# EAGLE board RK628H-30P-RevA (EAGLE 9.7.0)
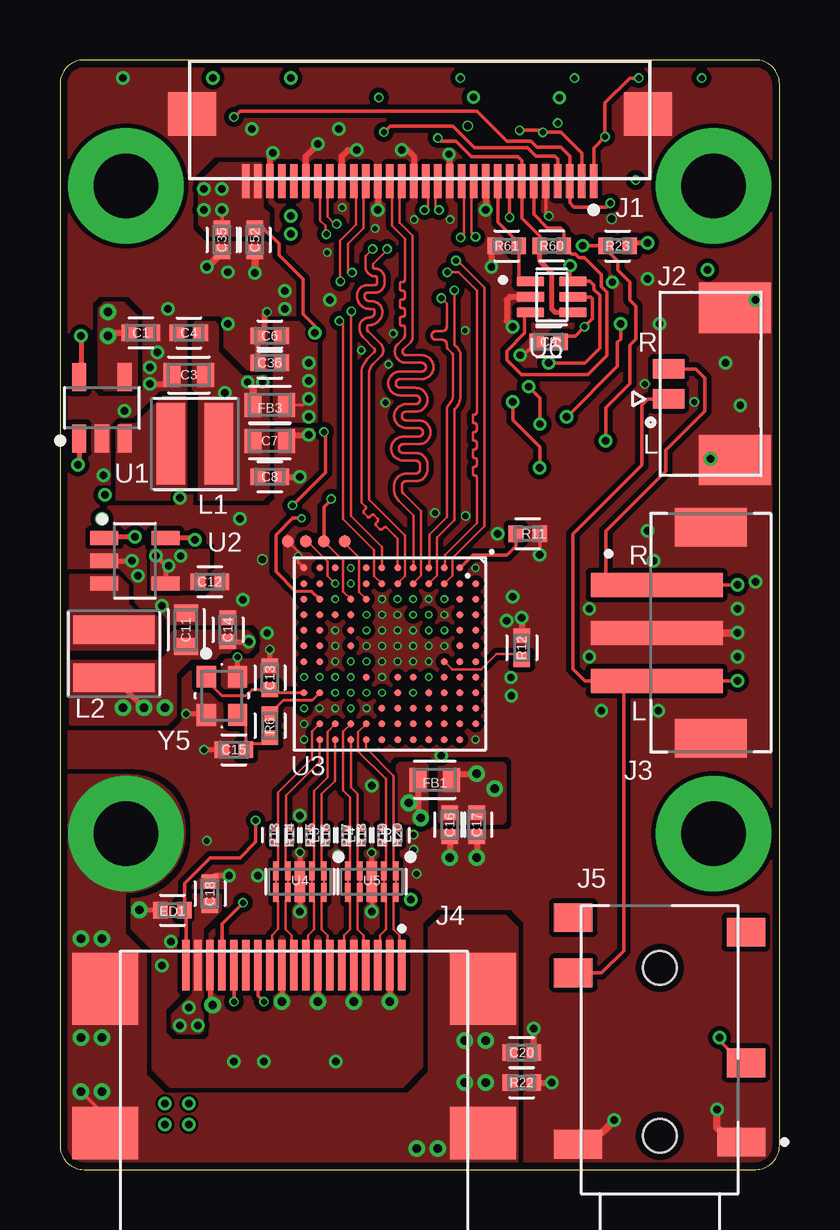
[diagram p8: board, top side]
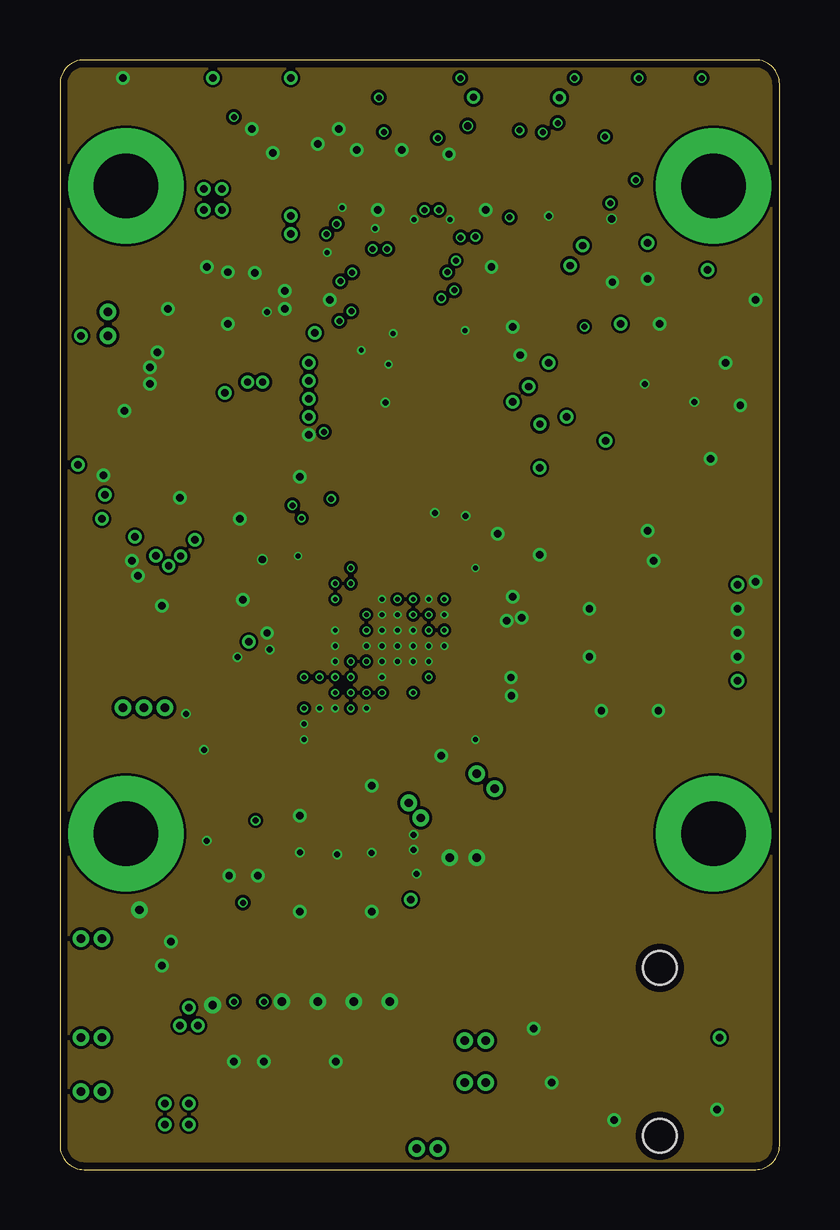
[diagram p9: board, inner layer Route2]
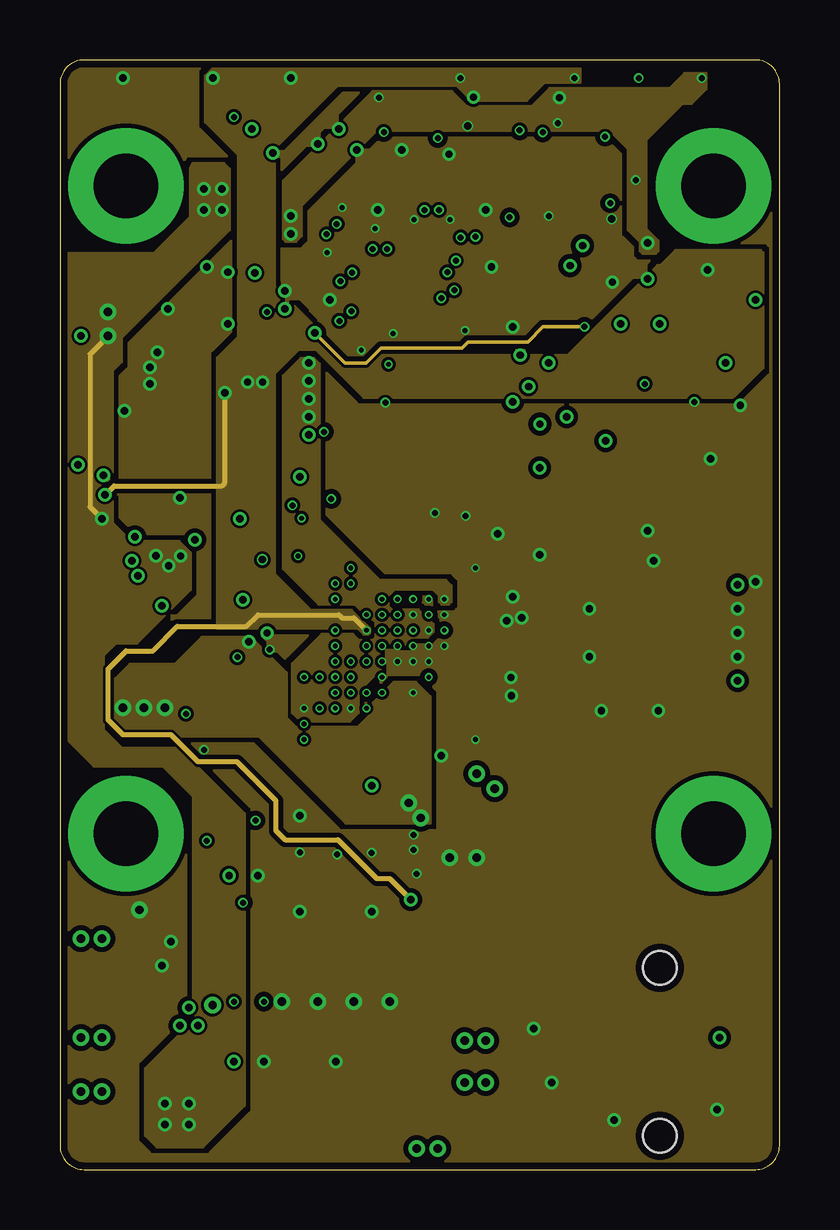
[diagram p10: board, inner layer Route15]
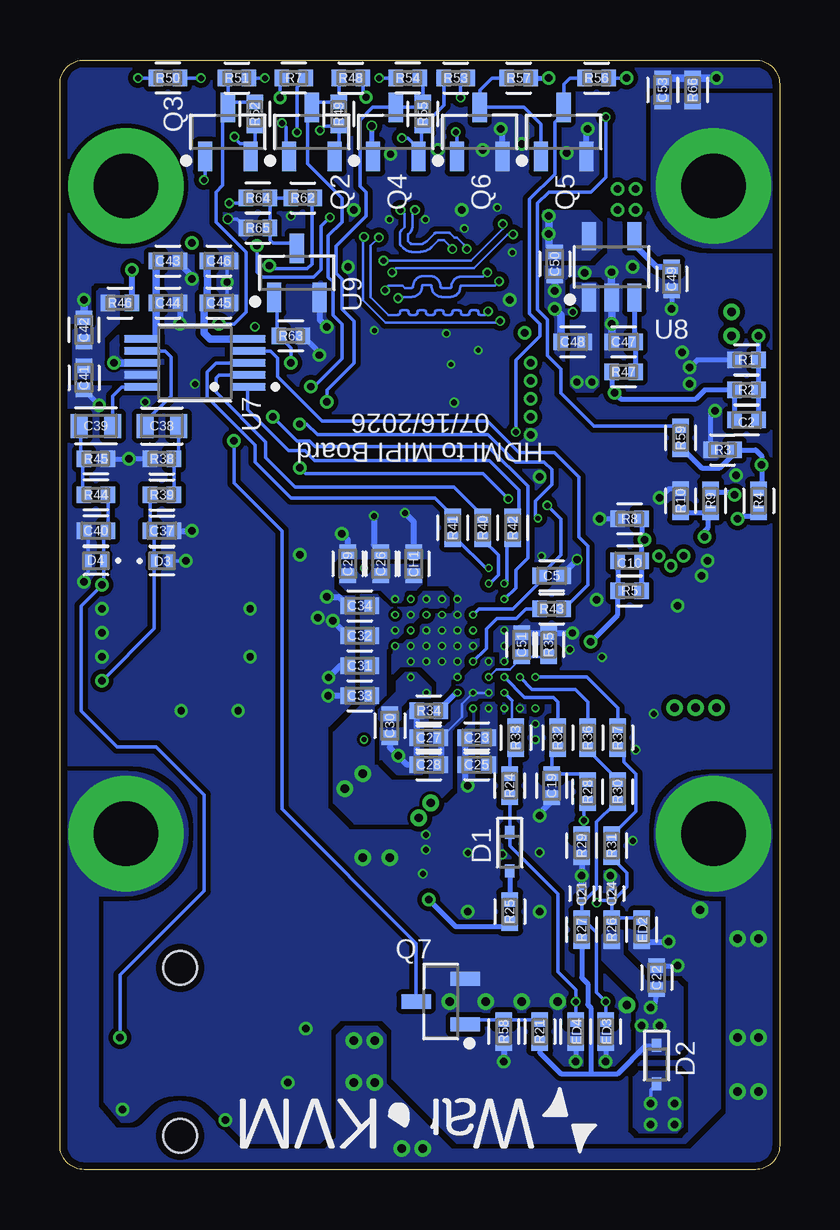
[diagram p11: board, bottom side, seen from below]

Size 30 x 46.25 mm. Coordinates in mm from the lower left corner, seen from the top.
Outline: 1,0 29,0 arc90 30,1 30,45.25 arc90 29,46.25 1,46.25 arc90 0,45.25 0,1 arc90 1,0
Copper layers (1+2*15+16): Top 0.035mm / dielectric 1.5mm / Route2 0.035mm / dielectric 0.15mm / Route15 0.035mm / dielectric 0.2mm / Bottom 0.035mm
Design rules "Fusion Electronics Design Rules *": minimum track width 0.1mm, minimum drill 0.2mm, track to track 0.12mm, track to pad 0.1mm, pad to pad 0.12mm, via to via 0.12mm, smd to smd 0.14mm, copper to edge 0.3mm, drill to drill 6mil, minimum pad ring 0mil, minimum via ring 0mil, stop-mask expansion 0mil, vias tented up to drill 9999mil, thermal gap 10mil
Net classes: 1 ether_diff: width 0.102 mm; 2 usb_diff: width 0.147 mm; 4 hdmi_diff: width 0.113 mm

## Footprints (pad centres in the part's own frame; a part is rotated, then mirrored left to right if it is on the bottom)
CAP_0402 = smd 0.6 x 0.7: 1 -0.5,0; 2 0.5,0
CAP_0603 = smd 0.7 x 1: 1 -0.7,0; 2 0.7,0
CAP_0201 = smd 0.25 x 0.35: 1 -0.275,0; 2 0.275,0
SD103AX = smd 0.54 x 0.404: A 0.796,0; C -0.796,0
DFN100X60X60-2N = smd 0.3 x 0.55: 1 -0.325,0; 2 0.325,0
TVS_0402 = smd 0.6 x 0.7: 1 -0.5,0; 2 0.5,0
IND_0603 = smd 0.7 x 1: 1 -0.7,0; 2 0.7,0
CONN_FFC_1X30_0.5MM_SM_RA_FPC30-T1T1-2021-A = smd 0.3 x 1.4: 1 -7.25,2.55; 2 -6.75,2.55; 3 -6.25,2.55; 4 -5.75,2.55; 5 -5.25,2.55; 6 -4.75,2.55; 7 -4.25,2.55; 8 -3.75,2.55; 9 -3.25,2.55; 10 -2.75,2.55; 11 -2.25,2.55; 12 -1.75,2.55; 13 -1.25,2.55; 14 -0.75,2.55; 15 -0.25,2.55; 16 0.25,2.55; 17 0.75,2.55; 18 1.25,2.55; 19 1.75,2.55; 20 2.25,2.55; 21 2.75,2.55; 22 3.25,2.55; 23 3.75,2.55; 24 4.25,2.55; 25 4.75,2.55; 26 5.25,2.55; 27 5.75,2.55; 28 6.25,2.55; 29 6.75,2.55; 30 7.25,2.55 | smd 2 x 1.8: 31 -9.5,-0.25; 32 9.5,-0.25
CONN_1X02_1.25MM_SM_ST_MX_53398-0271 = smd 0.8 x 1.3: 1 -0.625,2.25; 2 0.625,2.25 | smd 2.1 x 3: S1 3.175,-0.5; S2 -3.175,-0.5
CONN_1X03_2.0MM_SM_ST_JST_B3B-PH-SM4-TB(LF)(SN) = smd 1 x 5.5: 1 -2,-2.25; 2 0,-2.25; 3 2,-2.25 | smd 1.6 x 3: S1 -4.4,0; S2 4.4,0
CONN_HDMI_A_SMT_RA_HC-HDMI0019T-4 = smd 0.3 x 2.1: 1 4.5,6.4; 2 4,6.4; 3 3.5,6.4; 4 3,6.4; 5 2.5,6.4; 6 2,6.4; 7 1.5,6.4; 8 1,6.4; 9 0.5,6.4; 10 0,6.4; 11 -0.5,6.4; 12 -1,6.4; 13 -1.5,6.4; 14 -2,6.4; 15 -2.5,6.4; 16 -3,6.4; 17 -3.5,6.4; 18 -4,6.4; 19 -4.5,6.4 | smd 2.75 x 2.2: 20 -7.875,-0.6; 21 7.875,-0.6 | smd 2.75 x 3: 22 -7.875,5.4; 23 7.875,5.4
CONN_JACK_STEREO_SW_3.5MM_SM_RA_PJ-332-6A = smd 1.2 x 2: 1 2.15,-3.4; 2 2.05,3.4 | smd 1.2 x 1.6: 3 5.45,-3.6; 4 9.2,3.6; 5 10.9,-3.6; 6 11.5,3.6 | hole 1.4: 2.4,0; 9.4,0
IND_3MM_SQ_1.2MM_HEIGHT = smd 1.2 x 3.4: 1 -1,0; 2 1,0
BCMF062P120T = smd 0.25 x 0.35: 1 -0.275,0.3; 2 -0.275,-0.3; 3 0.275,-0.3; 4 0.275,0.3
MOUNTHOLE_M2.5_4.8MM_PAD = drill 2.7 pad 4.8: P$1 0,0
SOT-23-3 = smd 1.229 x 0.592: 1 1.022,-0.95; 2 1.022,0.95; 3 -1.022,0
RES_0402 = smd 0.6 x 0.7: 1 -0.5,0; 2 0.5,0
RES_0201 = smd 0.25 x 0.35: 1 -0.275,0; 2 0.275,0
TEST_POINT_0.5MM = smd 0.5 x 0.5: P$1 0,0
SOT95P285X110-5N = smd 1.172 x 0.592: 1 -1.275,0.95; 2 -1.275,0; 3 -1.275,-0.95; 4 1.275,-0.95; 5 1.275,0.95
WBBGA144_8X8MM = smd 0.3 x 0.3: A1 -3.575,3.575; A2 -2.925,3.575; A3 -2.275,3.575; A4 -1.625,3.575; A5 -0.975,3.575; A6 -0.325,3.575; A7 0.325,3.575; A8 0.975,3.575; A9 1.625,3.575; A10 2.275,3.575; A11 2.925,3.575; A12 3.575,3.575; B1 -3.575,2.925; B2 -2.925,2.925; B3 -2.275,2.925; B4 -1.625,2.925; B5 -0.975,2.925; B6 -0.325,2.925; B7 0.325,2.925; B8 0.975,2.925; B9 1.625,2.925; B10 2.275,2.925; B11 2.925,2.925; B12 3.575,2.925; C1 -3.575,2.275; C2 -2.925,2.275; C3 -2.275,2.275; C4 -1.625,2.275; C5 -0.975,2.275; C6 -0.325,2.275; C7 0.325,2.275; C8 0.975,2.275; C9 1.625,2.275; C10 2.275,2.275; C11 2.925,2.275; C12 3.575,2.275; D1 -3.575,1.625; D2 -2.925,1.625; D3 -2.275,1.625; D4 -1.625,1.625; D5 -0.975,1.625; D6 -0.325,1.625; D7 0.325,1.625; D8 0.975,1.625; D9 1.625,1.625; D10 2.275,1.625; D11 2.925,1.625; D12 3.575,1.625; E1 -3.575,0.975; E2 -2.925,0.975; E3 -2.275,0.975; E4 -1.625,0.975; E5 -0.975,0.975; E6 -0.325,0.975; E7 0.325,0.975; E8 0.975,0.975; E9 1.625,0.975; E10 2.275,0.975; E11 2.925,0.975; E12 3.575,0.975; F1 -3.575,0.325; F2 -2.925,0.325; F3 -2.275,0.325; F4 -1.625,0.325; F5 -0.975,0.325; F6 -0.325,0.325; F7 0.325,0.325; F8 0.975,0.325; F9 1.625,0.325; F10 2.275,0.325; F11 2.925,0.325; F12 3.575,0.325; G1 -3.575,-0.325; G2 -2.925,-0.325; G3 -2.275,-0.325; G4 -1.625,-0.325; G5 -0.975,-0.325; G6 -0.325,-0.325; G7 0.325,-0.325; G8 0.975,-0.325; G9 1.625,-0.325; G10 2.275,-0.325; G11 2.925,-0.325; G12 3.575,-0.325; H1 -3.575,-0.975; H2 -2.925,-0.975; H3 -2.275,-0.975; H4 -1.625,-0.975; H5 -0.975,-0.975; H6 -0.325,-0.975; H7 0.325,-0.975; H8 0.975,-0.975; H9 1.625,-0.975; H10 2.275,-0.975; H11 2.925,-0.975; H12 3.575,-0.975; J1 -3.575,-1.625; J2 -2.925,-1.625; J3 -2.275,-1.625; J4 -1.625,-1.625; J5 -0.975,-1.625; J6 -0.325,-1.625; J7 0.325,-1.625; J8 0.975,-1.625; J9 1.625,-1.625; J10 2.275,-1.625; J11 2.925,-1.625; J12 3.575,-1.625; K1 -3.575,-2.275; K2 -2.925,-2.275; K3 -2.275,-2.275; K4 -1.625,-2.275; K5 -0.975,-2.275; K6 -0.325,-2.275; K7 0.325,-2.275; K8 0.975,-2.275; K9 1.625,-2.275; K10 2.275,-2.275; K11 2.925,-2.275; K12 3.575,-2.275; L1 -3.575,-2.925; L2 -2.925,-2.925; L3 -2.275,-2.925; L4 -1.625,-2.925; L5 -0.975,-2.925; L6 -0.325,-2.925; L7 0.325,-2.925; L8 0.975,-2.925; L9 1.625,-2.925; L10 2.275,-2.925; L11 2.925,-2.925; L12 3.575,-2.925; M1 -3.575,-3.575; M2 -2.925,-3.575; M3 -2.275,-3.575; M4 -1.625,-3.575; M5 -0.975,-3.575; M6 -0.325,-3.575; M7 0.325,-3.575; M8 0.975,-3.575; M9 1.625,-3.575; M10 2.275,-3.575; M11 2.925,-3.575; M12 3.575,-3.575
DFN2510-10 = smd 0.224 x 0.793: 1 -1,-0.455; 2 -0.5,-0.455; 4 0.5,-0.455; 5 1,-0.455; 6 1,0.455; 7 0.5,0.455; 9 -0.5,0.455; 10 -1,0.455 | smd 0.424 x 0.793: 3 0,-0.455; 8 0,0.455
SOT65P210X110-6N = smd 1.15 x 0.4: 1 0.89,-0.65; 2 0.89,0; 3 0.89,0.65; 4 -0.89,0.65; 5 -0.89,0; 6 -0.89,-0.65
SOP50P490X110-10N = smd 0.32 x 1.5: 1 -1,-2.2; 2 -0.5,-2.2; 3 0,-2.2; 4 0.5,-2.2; 5 1,-2.2; 6 1,2.2; 7 0.5,2.2; 8 0,2.2; 9 -0.5,2.2; 10 -1,2.2
SOT95P285X110-5N_ROTATED90 = smd 0.592 x 1.172: 1 -0.95,-1.275; 2 0,-1.275; 3 0.95,-1.275; 4 0.95,1.275; 5 -0.95,1.275
CRYSTAL_SMD2016-4P = smd 0.9 x 0.8: 1 -0.8,-0.65; 2 0.8,-0.65; 3 0.8,0.65; 4 -0.8,0.65

## Placement (x,y rotation side)
C1  10uF 10V  [CAP_0402]  3.38,34.88 180 top
C2  100pF 50V  [CAP_0402]  1.38,31.25 180 bottom
C3  22uF 10V  [CAP_0603]  5.38,33.12 0 top
C4  0.1uF 16V  [CAP_0402]  5.38,34.88 0 top
C5  0.1uF 16V  [CAP_0402]  9.5,24.75 180 bottom
C6  10uF 10V  [CAP_0402]  8.75,34.75 0 top
C7  22uF 10V  [CAP_0603]  8.75,30.38 180 top
C8  0.1uF 16V  [CAP_0402]  8.75,28.88 180 top
C9  0.1uF 16V  [CAP_0402]  20.38,34.5 180 top
C10  100pF 50V  [CAP_0402]  6.25,25.38 180 bottom
C11  22uF 10V  [CAP_0603]  5.25,22.5 270 top
C12  10uF 10V  [CAP_0402]  6.25,24.5 180 top
C13  33pF 50V  [CAP_0402]  8.75,20.5 270 top
C14  0.1uF 16V  [CAP_0402]  7,22.5 270 top
C15  33pF 50V  [CAP_0402]  7.25,17.5 0 top
C16  0.1uF 16V  [CAP_0402]  16.25,14.38 90 top
C17  10uF 10V  [CAP_0402]  17.38,14.38 90 top
C18  0.1uF 16V  [CAP_0402]  6.25,11.5 270 top
C19  0.1uF 16V  [CAP_0402]  9.5,16 90 bottom
C20  0.1uF 16V  [CAP_0402]  19.25,4.88 180 top
C21  NC/10pF 50V  [CAP_0201]  8.25,11.5 270 bottom
C22  1uF 25V  [CAP_0402]  5.12,8 270 bottom
C23  10uF 10V  [CAP_0402]  12.62,18 0 bottom
C24  NC/10pF 50V  [CAP_0201]  7,11.5 270 bottom
C25  0.1uF 16V  [CAP_0402]  12.62,16.88 0 bottom
C26  10uF 10V  [CAP_0402]  16.62,25.25 270 bottom
C27  0.1uF 16V  [CAP_0402]  14.62,18 0 bottom
C28  10uF 10V  [CAP_0402]  14.62,16.88 0 bottom
C29  0.1uF 16V  [CAP_0402]  18,25.25 270 bottom
C30  0.1uF 16V  [CAP_0402]  16.25,18.5 270 bottom
C31  0.1uF 16V  [CAP_0402]  17.5,21 0 bottom
C32  0.1uF 16V  [CAP_0402]  17.5,22.25 0 bottom
C33  10uF 10V  [CAP_0402]  17.5,19.75 0 bottom
C34  0.1uF 16V  [CAP_0402]  17.5,23.5 0 bottom
C35  0.1uF 16V  [CAP_0402]  6.75,38.75 270 top
C36  0.1uF 16V  [CAP_0402]  8.75,33.62 0 top
C37  4.3nF 10V  [CAP_0402]  25.75,26.62 0 bottom
C38  3.3uF 10V  [CAP_0603]  25.75,31 0 bottom
C39  3.3uF 10V  [CAP_0603]  28.5,31 180 bottom
C40  4.3nF 10V  [CAP_0402]  28.5,26.62 180 bottom
C41  0.1uF 16V  [CAP_0402]  29,33 270 bottom
C42  10uF 10V  [CAP_0402]  29,35 90 bottom
C43  10uF 10V  [CAP_0402]  25.5,37.88 0 bottom
C44  0.1uF 16V  [CAP_0402]  25.5,36.12 0 bottom
C45  10uF 10V  [CAP_0402]  23.38,36.12 0 bottom
C46  0.1uF 16V  [CAP_0402]  23.38,37.88 0 bottom
C47  0.1uF 16V  [CAP_0402]  6.5,34.5 180 bottom
C48  4.7uF 10V  [CAP_0402]  8.62,34.5 180 bottom
C49  0.1uF 16V  [CAP_0402]  4.5,37.12 270 bottom
C50  4.7uF 10V  [CAP_0402]  9.38,37.75 270 bottom
C51  0.1uF 16V  [CAP_0402]  10.75,21.88 90 bottom
C52  10uF 10V  [CAP_0402]  8.12,38.75 270 top
C53  0.1uF 16V  [CAP_0402]  4.88,45 270 bottom
CH1  0.1uF 16V  [CAP_0402]  15.25,25.25 270 bottom
D1  SD103AX  [SD103AX]  11.25,13.25 270 bottom
D2  SD103AX  [SD103AX]  5.12,4.38 270 bottom
D3  ESD5451N  [DFN100X60X60-2N]  25.75,25.38 0 bottom
D4  ESD5451N  [DFN100X60X60-2N]  28.5,25.38 180 bottom
ED1  KLXES15AAA1  [TVS_0402]  4.69,10.81 0 top
ED2  KLXES15AAA1  [TVS_0402]  5.75,10 90 bottom
ED3  KLXES15AAA1  [TVS_0402]  7.25,5.75 90 bottom
ED4  KLXES15AAA1  [TVS_0402]  8.5,5.75 90 bottom
FB1  120Ω 2A  [IND_0603]  15.62,16.25 0 top
FB3  120Ω 2A  [IND_0603]  8.75,31.88 0 top
J1  FPC30-T1T1-2021-A  [CONN_FFC_1X30_0.5MM_SM_RA_FPC30-T1T1-2021-A]  15,43.75 180 top
J2  53398-0271  [CONN_1X02_1.25MM_SM_ST_MX_53398-0271]  27.62,32.75 90 top
J3  B3B-PH-SM4-TB  [CONN_1X03_2.0MM_SM_ST_JST_B3B-PH-SM4-TB(LF)(SN)]  27.12,22.38 270 top
J4  HC-HDMI0019T-4  [CONN_HDMI_A_SMT_RA_HC-HDMI0019T-4]  9.75,2.12 0 top
J5  PJ-332-6A  [CONN_JACK_STEREO_SW_3.5MM_SM_RA_PJ-332-6A]  25,-1 90 top
L1  2.2uH 2.84A  [IND_3MM_SQ_1.2MM_HEIGHT]  5.62,30.25 0 top
L2  2.2uH 2.84A  [IND_3MM_SQ_1.2MM_HEIGHT]  2.25,21.5 270 top
L3  NC/BCMF062P120T  [BCMF062P120T]  9.25,13.94 270 top
L4  NC/BCMF062P120T  [BCMF062P120T]  10.75,13.94 270 top
L5  NC/BCMF062P120T  [BCMF062P120T]  12.25,13.94 270 top
L6  NC/BCMF062P120T  [BCMF062P120T]  13.75,13.94 270 top
MNT1  MOUNTHOLE_M2.5_4.8MM_PAD  [MOUNTHOLE_M2.5_4.8MM_PAD]  2.75,41 0 top
MNT2  MOUNTHOLE_M2.5_4.8MM_PAD  [MOUNTHOLE_M2.5_4.8MM_PAD]  27.25,41 0 top
MNT3  MOUNTHOLE_M2.5_4.8MM_PAD  [MOUNTHOLE_M2.5_4.8MM_PAD]  2.75,14 0 top
MNT4  MOUNTHOLE_M2.5_4.8MM_PAD  [MOUNTHOLE_M2.5_4.8MM_PAD]  27.25,14 0 top
Q2  2SK3018  [SOT-23-3]  19.5,43.25 270 bottom
Q3  2SK3018  [SOT-23-3]  23,43.25 270 bottom
Q4  2SK3018  [SOT-23-3]  16,43.25 270 bottom
Q5  2SK3018  [SOT-23-3]  9,43.25 270 bottom
Q6  2SK3018  [SOT-23-3]  12.5,43.25 270 bottom
Q7  S8050  [SOT-23-3]  14.12,7 0 bottom
R1  51kΩ 1%  [RES_0402]  1.38,33.75 180 bottom
R2  232kΩ 1%  [RES_0402]  1.38,32.5 0 bottom
R3  47kΩ 1%  [RES_0402]  2.38,30 0 bottom
R4  47kΩ 1%  [RES_0402]  0.88,27.88 270 bottom
R5  110kΩ 1%  [RES_0402]  6.25,24.12 0 bottom
R6  22Ω 1%  [RES_0402]  8.75,18.5 270 top
R7  NC/2.2kΩ 1%  [RES_0402]  20.25,45.5 180 bottom
R8  120kΩ 1%  [RES_0402]  6.25,27.12 180 bottom
R9  10kΩ 1%  [RES_0402]  2.88,27.88 90 bottom
R10  100kΩ 1%  [RES_0402]  4.12,27.88 90 bottom
R11  4.02kΩ 1%  [RES_0402]  19.5,26.5 180 top
R12  10kΩ 1%  [RES_0402]  19.25,21.75 270 top
R13  2.2Ω 5%  [RES_0201]  8.94,13.94 90 top
R14  2.2Ω 5%  [RES_0201]  9.56,13.94 90 top
R15  2.2Ω 5%  [RES_0201]  10.44,13.94 90 top
R16  2.2Ω 5%  [RES_0201]  11.06,13.94 90 top
R17  2.2Ω 5%  [RES_0201]  11.94,13.94 90 top
R18  2.2Ω 5%  [RES_0201]  12.56,13.94 90 top
R19  2.2Ω 5%  [RES_0201]  13.44,13.94 90 top
R20  2.2Ω 5%  [RES_0201]  14.06,13.94 90 top
R21  10kΩ 1%  [RES_0402]  10,5.75 270 bottom
R22  1MΩ 1%  [RES_0402]  19.25,3.62 0 top
R23  4.7kΩ 1%  [RES_0402]  23.25,38.5 0 top
R24  100Ω 1%  [RES_0402]  11.25,16 90 bottom
R25  27kΩ 1%  [RES_0402]  11.25,10.75 270 bottom
R26  1.8kΩ 1%  [RES_0402]  7,10 90 bottom
R27  1.8kΩ 1%  [RES_0402]  8.25,10 90 bottom
R28  1kΩ 1%  [RES_0402]  8,15.75 90 bottom
R29  100kΩ 1%  [RES_0402]  8.25,13.5 90 bottom
R30  100Ω 1%  [RES_0402]  6.75,15.75 90 bottom
R31  100Ω 1%  [RES_0402]  7,13.5 90 bottom
R32  22Ω 1%  [RES_0402]  9.25,18 270 bottom
R33  22Ω 1%  [RES_0402]  11,18 270 bottom
R34  2kΩ 1%  [RES_0402]  14.62,19.12 0 bottom
R35  100Ω 1%  [RES_0402]  9.62,21.88 90 bottom
R36  22Ω 1%  [RES_0402]  8,18 270 bottom
R37  22Ω 1%  [RES_0402]  6.75,18 270 bottom
R38  10kΩ 1%  [RES_0402]  25.75,29.62 0 bottom
R39  470Ω 1%  [RES_0402]  25.75,28.12 0 bottom
R40  33Ω 1%  [RES_0402]  12.38,26.75 90 bottom
R41  33Ω 1%  [RES_0402]  13.62,26.75 90 bottom
R42  33Ω 1%  [RES_0402]  11.12,26.75 90 bottom
R43  33Ω 1%  [RES_0402]  9.5,23.38 0 bottom
R44  470Ω 1%  [RES_0402]  28.5,28.12 180 bottom
R45  10kΩ 1%  [RES_0402]  28.5,29.62 180 bottom
R46  10Ω 1%  [RES_0402]  27.5,36.12 0 bottom
R47  10kΩ 1%  [RES_0402]  6.5,33.25 180 bottom
R48  2.2kΩ 1%  [RES_0402]  17.88,45.5 0 bottom
R49  NC/0Ω 1%  [RES_0402]  18.38,44 90 bottom
R50  NC/2.2kΩ 1%  [RES_0402]  25.5,45.5 180 bottom
R51  2.2kΩ 1%  [RES_0402]  22.62,45.5 0 bottom
R52  NC/0Ω 1%  [RES_0402]  21.88,44 90 bottom
R53  NC/2.2kΩ 1%  [RES_0402]  13.5,45.5 0 bottom
R54  2.2kΩ 1%  [RES_0402]  15.5,45.5 180 bottom
R55  NC/0Ω 1%  [RES_0402]  14.88,44 90 bottom
R56  10kΩ 1%  [RES_0402]  7.62,45.5 0 bottom
R57  10kΩ 1%  [RES_0402]  10.88,45.5 0 bottom
R58  51kΩ 1%  [RES_0402]  11.5,5.75 90 bottom
R59  NC/1kΩ 1%  [RES_0402]  4.12,30.5 90 bottom
R60  NC/0Ω 1%  [RES_0402]  20.5,38.5 180 top
R61  NC/1MΩ 1%  [RES_0402]  18.62,38.5 0 top
R62  0Ω 1%  [RES_0402]  19.88,40.5 0 bottom
R63  NC/100kΩ 1%  [RES_0402]  20.38,34.75 180 bottom
R64  10kΩ 1%  [RES_0402]  21.75,40.5 180 bottom
R65  30kΩ 1%  [RES_0402]  21.75,39.25 0 bottom
R66  1MΩ 1%  [RES_0402]  3.62,45 90 bottom
TP1  TEST_POINT_1MM  [TEST_POINT_0.5MM]  9.5,26.19 0 top
TP2  TEST_POINT_1MM  [TEST_POINT_0.5MM]  10.25,26.19 0 top
TP3  TEST_POINT_1MM  [TEST_POINT_0.5MM]  11.88,26.19 0 top
TP4  TEST_POINT_1MM_0.5MM  [TEST_POINT_0.5MM]  11,26.19 0 top
U1  SY8089A1AAC  [SOT95P285X110-5N]  1.75,31.75 90 top
U2  SY8089A1AAC  [SOT95P285X110-5N]  3.12,25.38 0 top
U3  RK628H  [WBBGA144_8X8MM]  13.75,21.5 270 top
U4  BTRD10A03  [DFN2510-10]  10,12 180 top
U5  BTRD10A03  [DFN2510-10]  13,12 180 top
U6  SGM3157YC6  [SOT65P210X110-6N]  20.5,36.38 180 top
U7  GC4344  [SOP50P490X110-10N]  24.38,33.62 90 bottom
U8  RT9193-33GB  [SOT95P285X110-5N_ROTATED90]  7,37.62 0 bottom
U9  NC/ME2808A33XG  [SOT-23-3]  20.12,37.38 270 bottom
Y5  24MHz 20pF  [CRYSTAL_SMD2016-4P]  6.75,19.75 270 top

## Tracks (layer width: path | path; a pad name or v marks a point on that pad's centre or on a via)
CGND  (via drill 0.35 pad 0.7)
  Top 0.152: J4.20 1.88,2.25 v0.88,3.25
  other vias: 1.75,3.25 0.88,5.5 1.75,5.5 0.88,9.62 1.75,9.62 15.75,0.88 14.88,0.88 16.88,5.38 17.75,5.38 16.88,3.62 17.75,3.62
  pour Top (no thermals): 3.57,3.98 3.57,8.98 2.7,9.85 2.7,11.5 2.7,11.52 2.7,11.52 2.7,11.52 2.71,11.53 2.73,11.55 2.73,11.55 2.73,11.55 2.75,11.55 3.1,11.58 3.44,11.65 3.77,11.77 4.07,11.94 4.35,12.15 4.6,12.4 4.81,12.68 4.98,12.98 5.1,13.31 5.17,13.65 5.2,14 5.2,14.16 5.17,14.52 5.09,14.87 4.95,15.2 4.76,15.5 4.53,15.78 4.25,16.01 3.95,16.2 3.62,16.34 3.27,16.42 2.91,16.45 -0.82,16.45 -0.82,0.27 -0.35,-0.2 19.07,-0.2 19.07,10.1 18.6,10.57 15.9,10.57 15.39,10.07 15.39,4.07 14.49,3.16 4.39,3.16
  pour Bottom (no thermals): 3.73,0.8 3.71,0.81 2.19,2.33 2.17,2.36 2.17,11.39 2.19,11.42 2.21,11.44 2.23,11.45 2.75,11.45 3.09,11.48 3.43,11.55 3.76,11.67 4.06,11.84 4.34,12.04 4.58,12.29 4.79,12.56 4.95,12.87 5.08,13.19 5.15,13.53 5.17,13.88 5.17,14.15 5.15,14.51 5.06,14.86 4.93,15.19 4.74,15.49 4.51,15.76 4.24,15.99 3.94,16.18 3.61,16.31 3.26,16.4 2.9,16.42 0.08,16.42 0.08,0.03 0.16,-0.05 30.3,-0.05 30.3,16.55 27.17,16.55 26.82,16.52 26.48,16.45 26.14,16.33 25.84,16.16 25.55,15.95 25.3,15.7 25.09,15.41 24.92,15.11 24.8,14.77 24.73,14.43 24.7,14.08 24.73,13.71 24.81,13.34 24.94,12.99 25.12,12.66 25.34,12.36 25.61,12.09 25.91,11.87 26.24,11.69 26.59,11.56 26.96,11.48 27.33,11.45 28.39,11.45 28.42,11.44 28.44,11.42 28.45,11.39 28.45,2.63 28.45,2.62 28.45,2.61 28.45,2.61 28.45,2.6 28.44,2.59 28.44,2.58 28.44,2.58 28.43,2.57 27.69,1.71 27.69,1.71 27.68,1.7 27.67,1.69 27.67,1.69 27.67,1.69 27.66,1.68 27.65,1.68 27.64,1.67 27.64,1.67 27.63,1.67 27.62,1.67 27.61,1.67 27.01,1.67 27.01,1.67 27,1.67 26.98,1.67 26.98,1.68 26.88,1.69 26.87,1.68 26.87,1.69 26.86,1.69 26.85,1.69 26.75,1.72 26.75,1.72 26.74,1.73 26.73,1.73 26.73,1.73 26.64,1.78 26.63,1.78 26.62,1.79 26.62,1.79 26.61,1.8 26.53,1.86 26.53,1.86 26.52,1.87 26.51,1.88 26.51,1.88 25.98,2.41 25.82,2.55 25.65,2.66 25.46,2.73 25.25,2.78 25.05,2.8 24.95,2.8 24.75,2.78 24.54,2.73 24.35,2.66 24.18,2.55 24.02,2.41 22.42,0.81 22.39,0.8 18.98,0.8 18.96,0.81 18.44,1.33 18.42,1.36 18.42,5.59 18.09,5.92 16.78,5.92 16.45,5.59 16.45,3.61 16.44,3.58 13.67,0.81 13.64,0.8
GND  (via drill 0.2 pad 0.33, 0.2 pad 0.35, 0.25 pad 0.4, 0.3 pad 0.4, 0.3 pad 0.55, 0.35 pad 0.7)
  Top 0.113: v9.93,25.57 9.93,25.76 TP1.P$1
  Top 0.152: J1.5 20.25,39.88 v20.38,39.75 | R11.1 v20,25.62 | C7.1 9.5,30.43 9.5,30.62 | C9.2 19.32,33.95 v19.19,33.95 | U3.M1 9.93,25.32 v9.93,25.57
  Top 0.203: J4.5 v12.25,7 | J4.2 v13.75,7 | J4.8 v10.75,7 | J4.11 v9.25,7 | v13,10.75 U5.8 U5.3 v12.99,13.21 | v10,10.75 U4.8 U4.3 v10,13.22 | C15.1 v6,17.5 | Y5.2 6.05,19 v5.25,19 | Y5.4 v7.4,21.35 v7.4,21.36 | v8.74,21.67 C13.1 | ED1.1 v3.32,10.81 v3.31,10.82 | v6.36,6.85 6.25,6.97 J4.17 | U2.2 v3,25.38 | C36.1 C6.1 8.5,35 8.5,35.62 v8.62,35.75
  Top 0.254: 6.17,12.08 C18.1 6.5,12.25 v7.05,12.25 | v3.75,32.75 4.3,32.75 C3.1 | J1.28 8.75,42.25 v8.88,42.38 | J1.25 10.25,42.25 v10.75,42.75 | J1.22 11.75,42.25 12,42.5 v12.38,42.5 | J1.19 v13.25,40 | v14.25,42.5 14.5,42.5 14.75,42.25 J1.16 | v16.22,42.33 16.24,42.3 J1.13 | J1.10 v17.75,40 | C16.1 v16.25,13 | C17.1 v17.38,13 | R61.1 17.98,38.36 v17.98,37.63 | U6.2 18.75,36.38 18.62,36.25 18.62,35.38 v18.88,35.12 | v19.25,23 R12.1 | 9.5,30.62 v10.38,30.62 | C8.1 v10,28.88 | C20.1 v19.75,5.88 | R22.2 v20.5,3.62
  Top 0.305: J3.2 v28.25,22.38 | v23.11,2.06 22.1,1.05 J5.2 | J5.1 28,1.15 27.39,1.75 v27.39,2.5 | C35.2 v6.12,37.62 | C52.2 v8.12,37.38
  Bottom 0.152: C37.2 25.43,26.45 | C40.2 28.82,26.45 D4.2 28.82,24.93 29,24.75 v29,24.5 | D3.2 v24.75,25.38 | C45.2 23.03,36.28 v23.03,36.99 23.03,37.72 C46.2 | R65.1 22.62,39.62 v23,39.62
  Bottom 0.203: ED4.1 v8.5,4.5 | ED3.1 v7.25,4.5 | C22.1 v4.25,8.5 | R1.2 3.44,33.75 v3.75,33.44 | R3.1 2.88,31.62 v2.69,31.62 | R10.2 4.62,28.38 v5,28 | R8.2 v7.5,27.12 | C49.2 v4.5,35.88 | R63.1 19.19,34.06 v19.19,33.95 | C41.2 28.37,31.87 v28.37,31.85 | R38.1 v27.12,29.62 R45.1 | C43.2 25,37.75 | C23.1 C25.1 13.12,16.12
  Bottom 0.254: R29.1 v8.25,12.25 C21.1 | v7.05,12.25 7.05,11.83 C24.1 | C19.1 9.5,15.38 10,14.88 v10,14.75 | ED2.1 v4.62,9.5 | C51.2 R35.2 9.61,22.36 v8.63,22.36 | Q5.2 8.05,43.33 v8,43.38 | Q6.2 11.55,43.3 v11.62,43.38 | C23.1 13.12,16.12 v13,16 | C37.2 v24.5,26.62 | U9.2 19.18,35.42 v18.88,35.12 | v18.82,19.75 C33.1 | v18.88,23.88 18.38,23.88 C34.1 | C32.1 v18.62,22.88 | C31.1 18.32,21 v18.8,20.51 | Q7.2 13.05,7.95 13,8 | C30.2 16.25,17.6 v15.9,17.25 15.52,16.88 C28.1 C27.1 R34.1 | R58.1 v11.5,4.5 | 25,37.75 24.5,37.25 v24.5,37.12 | C44.2 v25,35.25 | C29.1 18,26.25 v18.25,26.5 | v16.91,27.25 16.91,26.04 C26.1 | CH1.1 15.25,27 v15.62,27.38 | C5.1 9,24.86 v8.44,25.42
  Bottom 0.305: U7.8 v27.75,33.62 | C42.2 v29,36.25 | C50.2 v9.38,36.62 | C48.2 9.12,35.62 v9.38,35.88 | v7,37.41 U8.2 v7,35.25 C47.2 | C53.1 R66.2 v2.62,45.5
  other vias: 10.82,19.23 10.18,18.57 10.18,17.93 11.47,19.23 17.32,17.93 12.78,19.23 11.47,21.18 11.47,21.82 11.47,22.48 12.78,21.82 13.43,21.18 13.43,20.52 14.07,21.18 14.72,21.18 15.38,21.18 13.43,21.82 13.43,22.48 13.43,23.12 14.07,23.12 14.07,22.48 14.72,22.48 14.07,21.82 14.72,21.82 15.38,21.82 16.02,21.82 16.02,23.12 15.38,23.77 13.43,23.77 4.06,34.06 1.81,28.94 3.25,24.75 4.25,23.5 7.62,23.75 17.32,25.07 11.25,36.25 13.57,31.97 13.89,34.85 13.7,33.56 12.56,34.15 11.14,38.22 11.76,40.1 16.26,39.6 13.14,39.22 14.76,39.6 16.89,34.97 24.38,32.75 26.45,31.99 22.57,19.13 24.95,19.13 22.07,23.38 22.07,21.38 28.25,23.38 28.25,21.38 11.56,13.13 14.74,13.96 14.74,13.33 14.87,12.33 6.12,13.71
  pour Route2 (no thermals): -0.69,-0.19 30.19,-0.19 30.19,46.44 -0.69,46.44
  pour Top (no thermals): 3.56,35.44 3.56,32.6 3.15,32.19 1.59,32.19 1.37,31.98 1.37,28.56 2.07,28.56 2.07,31.02 2.41,31.37 3.04,31.37 4.16,32.49 5.16,32.49 5.26,32.59 5.26,35.35 5.16,35.44
  pour Top (no thermals): 3.17,23.66 3.35,23.47 3.99,23.47 4.02,23.46 4.66,22.83 7.92,22.83 7.92,24.92 6.41,24.92 6.33,24.84 6.33,24.11 6.31,24.08 6.04,23.81 6.02,23.8 3.73,23.8 3.71,23.81 3.56,23.96 3.55,23.98 3.55,25.8 0.45,25.8 0.45,25.12 2.43,25.12 2.46,25.11 3.16,24.41 3.17,24.38
  pour Route15 (no thermals): 11.52,34.68 15.73,34.68 18.2,37.15 18.2,39.98 17.48,40.7 11.9,40.7 10.43,39.23 10.43,35.77
  pour Top (isolate 0.203, rank 6, no thermals): -0.69,-0.19 30.19,-0.19 30.19,46.44 -0.69,46.44
  pour Bottom (isolate 0.203, rank 6, no thermals): -0.6,-0.15 30.28,-0.15 30.28,46.49 -0.6,46.49
  pour Route15 (isolate 0.203, rank 6, no thermals): -0.69,-0.19 30.19,-0.19 30.19,46.44 -0.69,46.44
HDMI_1-CEC  (via drill 0.25 pad 0.4)
  Top 0.152: J4.13 8.25,7.25 v8.5,7
  Bottom 0.152: ED4.2 v8.5,7 8.5,7.5 9.25,8.25 9.25,11.5 11.25,13.5 D1.C R24.1
HDMI_1-HPD  (via drill 0.25 pad 0.4)
  Top 0.152: J4.19 5.25,10.75 ED1.2 5.19,11.94 6.25,13 7.5,13 8.16,13.66 v8.16,14.55
  Bottom 0.152: R28.1 8.16,15.09 v8.16,14.55 8.16,14.09 R29.2
HDMI_1-SCL  (via drill 0.25 pad 0.4)
  Top 0.152: J4.15 v7.25,7
  Bottom 0.152: R30.1 6.88,15.25 7.64,14.48 7.64,11.7 8.12,11.22 C21.2 R27.2 7.63,9.88 7.63,7.38 v7.25,7 ED3.2
HDMI_1-SDA  (via drill 0.25 pad 0.4)
  Top 0.152: J4.16 6.75,10.25 7.5,11 7.62,11 v7.62,11.12
  Bottom 0.152: R31.1 6.38,12.38 6.38,11.78 6.93,11.22 C24.2 | C24.2 R26.2 ED2.2 | C24.2 7.53,11.22 v7.62,11.12
HDMIIN_INTN  (via drill 0.25 pad 0.4)
  Top 0.152: v15.75,43 15.88,42.88 16.5,42.88 17.17,42.21 19.08,42.21 19.25,42.04 J1.7 19.25,39.65 20,38.9 R60.2
  Top 0.203: U6.4 20.65,35.73 20.5,35.88 20.5,37.38 20,37.88 R60.2
  Bottom 0.152: v15.75,43 15.5,43 15.05,42.55 Q4.2 15.05,42.38 14.93,42.38 14.93,43.45 R55.1 14,44.38 R53.1
HDMIIN_PWR_EN/DET  (via drill 0.25 pad 0.4)
  Top 0.152: v7.25,43.88 7.5,44.12 17.38,44.12 18.62,42.88 19.62,42.88 19.88,42.62 20.88,42.62 21.25,42.25 J1.3 21.25,40.29 21.42,40.12 22.78,40.12 v22.94,40.28
  Bottom 0.152: R59.2 7.75,31 9.12,32.38 9.12,33.38 9.69,33.94 9.69,35.44 10.09,35.84 10.09,40.28 9.62,40.75 7.88,40.75 7.25,41.38 v7.25,43.88 | v22.94,40.28 22.47,40.28 R64.2
HDMIIN_RSTN  (via drill 0.25 pad 0.4)
  Top 0.152: v13.5,43.25 13.75,43.5 16.38,43.5 17.28,42.59 19.5,42.59 19.84,42.25 20.62,42.25 20.75,42.12 J1.4
  Bottom 0.152: Q6.1 13.45,43.2 v13.5,43.25
HDMIRX_CEC
  Bottom 0.152: R33.2 11.25,17.25 R24.2
HDMIRX_DETN  (via drill 0.25 pad 0.4, 0.3 pad 0.55)
  Top 0.152: J1.8 v18.75,39.69 | v21.79,38.51 R23.1 22.75,38.38 23.25,37.88 23.25,37.5 23.75,37 23.75,36.25 24,36 24,34.62 23.75,34.38 23.75,32.77 22.75,31.77 v22.75,30.38
  Bottom 0.152: Q7.3 15.15,9.43 20.75,15.03 20.75,26.62 22.75,28.62 v22.75,30.38 | v18.75,39.69 19.12,39.31 19.12,37.51 19.43,37.21 21.58,37.21 21.79,37.41 v21.79,38.51
HDMIRX_HPD
  Bottom 0.152: R28.2 8.25,16.5 C19.2 9.5,17.25 R32.2
HDMIRX_SCL
  Bottom 0.152: R30.2 R36.2
HDMIRX_SDA
  Bottom 0.152: R37.2 6.5,17.25 6.5,17 6,16.5 6,14.93 6.93,14 R31.2
HRX0_1_N
  Top 0.113: J4.9 10.32,8.85 10.34,8.69 10.34,9.77 10.59,10.02 10.59,11.21 10.5,11.29 U4.9 U4.2 10.59,12.54 10.59,13.52 L4.3
HRX0_1_P
  Top 0.113: J4.7 11.16,8.94 11.16,9.75 10.91,10 10.91,11.46 U4.10 U4.1 10.91,12.54 10.91,13.52 L4.4
HRX0_N
  Top 0.113: U3.K11 11.15,18.25 11.15,16.33 10.6,15.79 10.6,14.32 10.49,14.21 L4.2
HRX0_P
  Top 0.113: U3.K12 11.46,17.91 11.46,16.2 10.91,15.65 10.91,14.32 11.03,14.21 R16.2
HRX1_1_N
  Top 0.113: J4.6 11.84,8.94 11.84,9.77 12.09,10.02 12.09,11.45 U5.6 U5.5 12.09,12.54 12.09,13.52 L5.3
HRX1_1_P
  Top 0.113: J4.4 12.66,8.94 12.66,9.75 12.41,10 12.41,11.45 U5.7 U5.4 12.41,12.54 12.41,13.52 L5.4
HRX1_N
  Top 0.113: U3.J11 11.81,18.26 11.81,15.8 12.09,15.52 12.09,14.35 L5.2
HRX1_P
  Top 0.113: U3.J12 12.12,15.94 12.41,15.65 12.41,14.32 12.51,14.21 L5.1
HRX2_1_N
  Top 0.113: J4.3 13.35,8.94 13.35,9.77 13.59,10.02 13.59,11.45 U5.9 U5.2 13.59,12.54 13.59,13.51 R19.1
HRX2_1_P
  Top 0.113: J4.1 14.16,8.94 14.16,9.76 13.91,10 13.91,11.45 U5.10 U5.1 13.91,12.54 13.91,13.52 L6.4
HRX2_N
  Top 0.113: U3.H11 12.43,18.23 12.43,17.43 13.59,16.28 13.59,14.32 13.47,14.21 R19.2
HRX2_P
  Top 0.113: U3.H12 12.75,17.9 12.75,17.57 13.9,16.41 13.9,14.32 14.01,14.21 L6.1
HRXC_1_N
  Top 0.113: J4.12 8.82,8.85 8.84,8.68 8.84,9.77 9.09,10.03 9.09,11.21 9,11.29 U4.6 U4.5 9.09,12.54 9.09,13.52 L3.3
HRXC_1_P
  Top 0.113: J4.10 9.66,9.02 9.66,9.77 9.41,10.02 9.41,11.21 9.5,11.29 U4.7 U4.4 9.41,12.54 9.41,13.52 L3.4
HRXC_N
  Top 0.113: U3.L11 10.51,18.26 10.51,17.13 9.1,15.72 9.1,14.32 8.99,14.21 L3.2
HRXC_P
  Top 0.113: U3.L12 10.82,17.91 10.82,16.99 9.43,15.59 9.43,14.32 9.54,14.21 R14.2
I2C_SCL_3V3  (via drill 0.2 pad 0.35, 0.3 pad 0.55)
  Top 0.127: 10.5,24.1 9.83,24.1
  Top 0.152: v19.54,32.63 20.01,32.16 v20.01,31.08 | U3.L3 10.5,24.1 | 9.83,24.1 9,24.93 9,26.45 9.7,27.15 v10.07,27.15
  Bottom 0.152: v20.01,31.08 19.71,31.08 19.26,30.63 12.15,30.63 11.01,29.49 11,29.5 9.81,29.5 9.5,29.18 9.5,28.54 10.17,27.88 10.17,27.24 v10.07,27.15 | v19.54,32.63 19.41,32.63 18.25,33.8 18.25,35.25 18.62,35.62 18.62,37 18.83,37.2 18.83,38.92 18.25,39.5 18.25,40.5 19.69,41.94 19.69,44.09 Q2.3 19.27,44.5 R49.2 R48.1
I2C_SDA_3V3  (via drill 0.2 pad 0.33, 0.3 pad 0.55)
  Top 0.152: v23.38,35.25 23.38,34.62 23.23,34.48 23.23,33.48 v21.12,31.38
  Bottom 0.152: U3.K3 11,24.25 11,25 10.5,25.5 10.5,28.48 12.16,30.14 19.36,30.14 19.6,30.38 20.12,30.38 v21.12,31.38 | v23.38,35.25 22.75,35.25 22.25,35.75 22.25,38.25 23.5,39.5 23.5,40.75 23.21,41.04 23.21,44.06 Q3.3 23,44.38 | R51.1 23,45.38 23,44.38 | R52.2 22.88,44.5 23,44.38
  other vias: 11.47,23.77
I2S_HDMI_LRCK
  Bottom 0.152: R41.2 14.38,28 20.38,28 21.88,29.5 21.88,30.2 23.88,32.2 23.88,33.25 23.5,33.62 U7.3
I2S_HDMI_MCLK
  Bottom 0.152: U7.4 21.21,34.12 20.92,33.83 20.92,33.04 19.08,31.2 12.18,31.2 10.87,29.89 9.38,29.89 8.38,28.88 8.38,26.38 8,26 8,24.38 R43.2
I2S_HDMI_SCLK
  Bottom 0.152: R40.2 13.57,28.45 20.2,28.45 21.42,29.67 21.42,30.33 23.5,32.41 23.5,33 23.38,33.12 U7.2
I2S_HDMI_SDI
  Bottom 0.152: R42.2 10.88,27.25 10.88,28.33 12.1,29.56 19.38,29.56 19.79,29.96 20.46,29.96 22.18,31.68 U7.1
L_OUT  (via drill 0.3 pad 0.55)
  Top 0.152: J3.3 v28.25,20.38 | J3.3 21.88,20.38 21.38,20.88 21.38,26.5 24.25,29.38 24.25,31.88 24.5,32.12 J2.1 | J5.4 22.57,8.2 23.5,9.12 23.5,20.38 J3.3
  Bottom 0.152: R39.1 C37.1 26.07,26.45 D3.1 26.07,22.55 v28.25,20.38
MIPI-CSI0-CK_N
  Top 0.113: J1.18 13.75,40.77 13.84,40.68 13.84,39.34 14.38,38.8 14.38,37.08 arc-90 14.29,37 14.26,37 arc90 14.18,36.92 14.18,36.71 arc90 14.26,36.63 14.29,36.63 arc-90 14.38,36.55 14.38,36.35 arc-90 14.29,36.27 14.26,36.27 arc90 14.18,36.19 14.18,35.99 arc90 14.26,35.91 14.29,35.91 arc-90 14.38,35.83 14.38,35.62 arc-90 14.29,35.54 14.26,35.54 arc90 14.18,35.47 14.18,35.26 arc90 14.26,35.18 14.29,35.18 arc-90 14.38,35.1 14.38,34.75 arc-45 14.34,34.66 14.08,34.41 arc45 13.96,34.1 arc90 14.43,33.63 15.08,33.63 arc-90 15.26,33.45 arc-90 15.08,33.26 14.18,33.26 arc90 13.68,32.77 arc90 14.18,32.27 14.83,32.27 arc-90 15.01,32.09 arc-90 14.83,31.91 14.43,31.91 arc90 13.93,31.41 arc90 14.43,30.91 14.95,30.91 arc-90 15.13,30.73 arc-90 14.95,30.55 14.31,30.55 arc90 13.81,30.05 arc90 14.31,29.55 14.83,29.55 arc-90 15.01,29.37 15.01,29.19 arc-90 14.83,29.01 14.43,29.01 arc90 13.93,28.51 13.93,28.34 arc45 14.13,27.87 14.74,27.26 14.74,25.09 U3.E1
MIPI-CSI0-CK_P
  Top 0.113: U3.E2 15.05,24.75 15.05,27.44 14.32,28.17 arc-45 14.25,28.34 14.25,28.51 arc-90 14.43,28.69 14.83,28.69 arc90 15.32,29.19 15.32,29.37 arc90 14.83,29.87 14.31,29.87 arc-90 14.12,30.05 arc-90 14.31,30.23 14.95,30.23 arc90 15.45,30.73 arc90 14.95,31.23 14.43,31.23 arc-90 14.25,31.41 arc-90 14.43,31.59 14.83,31.59 arc90 15.32,32.09 arc90 14.83,32.59 14.18,32.59 arc-90 14,32.77 arc-90 14.18,32.95 15.08,32.95 arc90 15.57,33.45 arc90 15.08,33.94 14.43,33.94 arc-135 14.32,34.2 14.62,34.5 arc45 14.69,34.66 14.69,38.93 14.16,39.47 14.16,40.68 14.25,40.77 J1.17
MIPI-CSI0-D0_N  (via drill 0.25 pad 0.4)
  Top 0.113: U3.G1 13.42,25.95 12.12,27.24 12.12,35.8 v12.15,35.77 | J1.12 16.82,41.2 16.84,41.18 16.84,38.99 v16.7,38.85
  Bottom 0.113: v12.15,35.77 12.3,35.62 12.48,35.62 arc90 12.56,35.7 12.56,35.73 arc-90 12.64,35.81 12.84,35.81 arc-90 12.92,35.73 12.92,35.7 arc90 13,35.62 13.2,35.62 arc90 13.28,35.7 13.28,35.73 arc-90 13.36,35.81 13.57,35.81 arc-90 13.65,35.73 13.65,35.7 arc90 13.72,35.62 13.93,35.62 arc90 14.01,35.7 14.01,35.73 arc-90 14.09,35.81 14.29,35.81 arc-90 14.37,35.73 14.37,35.7 arc90 14.45,35.62 14.65,35.62 arc90 14.73,35.7 14.73,35.73 arc-90 14.81,35.81 15.02,35.81 arc-90 15.1,35.73 15.1,35.7 arc90 15.18,35.62 15.38,35.62 arc90 15.46,35.7 15.46,35.73 arc-90 15.54,35.81 15.74,35.81 arc-90 15.82,35.73 15.82,35.7 arc90 15.9,35.62 16.3,35.62 17.04,36.37 17.04,38.51 v16.7,38.85
MIPI-CSI0-D0_P  (via drill 0.25 pad 0.4)
  Top 0.113: U3.G2 13.1,24.75 13.1,25.82 11.81,27.11 11.81,35.23 11.67,35.37 v11.65,35.37 | J1.11 17.18,41.2 17.16,41.18 17.16,39.04 v17.32,38.88
  Bottom 0.113: v11.65,35.37 11.71,35.31 16.43,35.31 17.36,36.24 17.36,38.84 v17.32,38.88
MIPI-CSI0-D1_N  (via drill 0.25 pad 0.4)
  Top 0.113: J1.15 15.32,41.2 15.34,41.18 15.34,40 v15.2,40 | U3.F1 14.07,26.07 14.07,26.3 13.96,26.41 13.62,26.76 arc90 13.5,26.76 13.44,26.7 arc-90 13.33,26.7 13.19,26.84 arc-90 13.19,26.95 13.25,27.02 arc90 13.25,27.13 13.1,27.27 arc90 12.99,27.27 12.93,27.21 arc-90 12.82,27.21 12.67,27.35 arc-90 12.67,27.47 12.73,27.53 arc90 12.73,27.64 12.57,27.81 12.57,33.17 arc-45 12.83,33.8 13.1,34.08 arc90 13.1,34.23 12.64,34.69 arc-45 12.49,35.05 12.49,35.12 arc-90 12.89,35.51 arc90 13.12,35.75 arc90 13,35.88 12.91,35.88 arc-90 12.38,36.4 12.38,36.42 arc-90 12.83,36.87 13.14,36.87 arc90 13.22,36.95 13.22,37.15 arc90 13.14,37.23 arc-90 12.74,37.63 12.74,38.08 v13.04,38.38
  Bottom 0.113: v13.04,38.38 13.16,38.5 13.16,38.55 13.45,38.84 13.54,38.84 13.73,39.02 arc-45 13.8,39.05 14.3,39.05 arc-45 14.39,39.02 14.7,38.7 arc45 15.03,38.56 15.28,38.56 arc45 15.41,38.62 15.5,38.71 15.5,38.93 arc45 15.48,38.99 15.4,39.06 arc-45 15.31,39.29 15.31,39.89 v15.2,40
MIPI-CSI0-D1_P  (via drill 0.25 pad 0.4)
  Top 0.113: J1.14 15.68,41.2 15.66,41.18 15.66,40 v15.8,40 | U3.F2 14.39,24.74 14.39,26.43 12.88,27.94 12.88,33.17 arc-45 13.06,33.58 13.39,33.91 arc45 13.48,34.14 arc45 13.38,34.4 12.86,34.92 arc-45 12.81,35.05 12.81,35.12 arc-90 12.89,35.2 arc90 13.45,35.75 arc90 13.01,36.19 12.91,36.19 arc-90 12.7,36.4 12.7,36.42 arc-90 12.83,36.55 13.14,36.55 arc90 13.53,36.95 13.53,37.15 arc90 13.14,37.55 arc-90 13.06,37.63 13.06,37.73 13.64,38.32 v13.64,38.38
  Bottom 0.113: v13.64,38.38 v13.63,38.38 13.98,38.73 14.22,38.73 14.5,38.45 arc45 15,38.25 15.27,38.25 arc45 15.7,38.43 15.78,38.51 arc45 15.83,38.62 15.83,38.99 arc45 15.77,39.15 15.63,39.29 15.63,39.78 arc-45 15.66,39.86 v15.8,40
MIPI-CSI0-D2_N  (via drill 0.25 pad 0.4)
  Top 0.113: U3.D1 15.4,25.1 15.4,26.47 16.12,27.2 16.12,31.66 arc-45 16.23,31.91 arc45 16.39,32.3 16.39,33.92 arc45 16.34,34.03 16.18,34.19 16.12,34.25 16.12,34.4 arc90 15.94,34.59 15.68,34.59 arc-90 15.49,34.77 arc-90 15.68,34.95 15.95,34.95 arc90 16.12,35.12 16.12,36.1 v15.9,36.32 | v11.69,37.02 v11.68,37.03 11.68,38.72 12.34,39.38 12.34,40.56 12.25,40.65 J1.21
  Bottom 0.113: v15.9,36.32 15.85,36.38 15.33,36.38 arc-90 14.9,36.81 arc90 14.85,36.86 14.56,36.86 arc90 14.51,36.81 arc-90 14.07,36.38 13.72,36.38 arc-90 13.31,36.79 arc90 13.25,36.84 11.87,36.84 v11.69,37.02
MIPI-CSI0-D2_P  (via drill 0.25 pad 0.4)
  Top 0.113: U3.D2 15.71,24.76 15.71,26.34 16.44,27.07 16.44,31.66 arc-45 16.45,31.69 arc45 16.71,32.3 16.71,33.92 arc45 16.57,34.25 16.45,34.37 16.45,36.64 v16.44,36.65 | v12.18,37.4 12,37.4 12,38.59 12.66,39.25 12.66,40.56 12.75,40.65 J1.20
  Bottom 0.113: v16.44,36.65 16.44,36.71 16.3,36.85 15.73,36.85 15.62,36.75 15.33,36.75 arc-90 15.28,36.81 arc90 14.85,37.24 14.56,37.24 arc90 14.13,36.81 arc-90 14.07,36.75 13.72,36.75 arc-90 13.69,36.79 arc90 13.25,37.22 12.36,37.22 v12.18,37.4
MIPI-CSI0-D3_N  (via drill 0.25 pad 0.4)
  Top 0.113: U3.C1 16.04,25.09 16.04,25.62 17.38,26.95 17.38,28.85 arc90 17.3,28.93 17.29,28.93 arc-90 17.21,29.01 17.21,29.21 arc-90 17.29,29.29 17.3,29.29 arc90 17.38,29.37 17.38,29.58 arc90 17.3,29.66 17.29,29.66 arc-90 17.21,29.74 17.21,29.94 arc-90 17.29,30.02 17.3,30.02 arc90 17.38,30.1 17.38,30.3 arc90 17.3,30.38 17.29,30.38 arc-90 17.21,30.46 17.21,30.67 arc-90 17.29,30.75 17.3,30.75 arc90 17.38,30.83 17.38,31.03 arc90 17.3,31.11 17.29,31.11 arc-90 17.21,31.19 17.21,31.39 arc-90 17.29,31.47 17.3,31.47 arc90 17.38,31.55 17.38,36.64 16.61,37.4 v16.15,37.4 | J1.24 10.75,40.65 10.84,40.56 10.84,39.56 11.07,39.33 11.07,39.03 v11.11,38.99
  Bottom 0.113: v16.15,37.4 15.98,37.56 12.74,37.56 11.34,38.96 11.14,38.96 v11.11,38.99
MIPI-CSI0-D3_P  (via drill 0.25 pad 0.4)
  Top 0.113: U3.C2 16.36,24.76 16.36,25.48 17.69,26.82 17.69,36.77 16.57,37.89 v16.51,37.89 | J1.23 11.25,40.65 11.16,40.56 11.16,39.71 11.45,39.41 v11.54,39.41
  Bottom 0.113: v16.51,37.89 15.56,37.89 15.56,37.88 12.87,37.88 11.54,39.21 v11.54,39.41
N$1
  pour Bottom (no thermals): 28.18,34.65 28.18,33.48 28.02,33.32 25.93,33.32 25.93,32.93 29.45,32.93 29.45,34.98 29.35,35.07 28.6,35.07 28.45,35.23 28.45,36.6 28.35,36.7 27.65,36.7 27.55,36.6 27.55,35.27
N$2
  Top 0.127: R6.2 8.5,17.75 8,17.75 C15.2 7.75,18.6 Y5.3
N$4
  Bottom 0.152: Q5.1 9.95,43.58 10.65,44.27 Q6.3 12.5,45 12,45.5 R57.1
N$6  (via drill 0.3 pad 0.55)
  Top 0.152: v21.27,37.68 21.27,37.15 U6.6 22.1,37.02 22.27,36.86 22.27,36.68 22.5,36.44 22.5,34.25 21.88,33.62 v20.38,33.62
  Bottom 0.152: U9.1 20.95,36.35 20.95,34.83 R63.2 20.38,34.25 v20.38,33.62 | R62.2 19.5,40.38 19.5,37.75 19.69,37.56 21.15,37.56 v21.27,37.68
N$7
  Bottom 0.152: U9.3 20.35,38.62 21.12,38.62 21.25,38.75 R65.2 R64.1 R62.1
N$8
  Bottom 0.152: C39.1 27.8,32.25 27.43,32.62 U7.10
N$9
  Bottom 0.152: R45.2 29.06,29.69 | 29.06,29.69 29.14,29.77 29.14,31 C39.2 | R44.2 29.06,28.26 29.06,29.69
N$10
  Bottom 0.254: C49.1 5.12,37.62 6.05,38.55 U8.4
N$11
  Bottom 0.203: D1.A R25.1
N$12
  Bottom 0.305: U7.5 23.75,34.62 24,34.88 24,36 C45.1 23.88,36.74 23.84,36.78 23.84,37.22 23.88,37.26 C46.1
N$13
  Bottom 0.305: U7.6 26,34.62 C44.1 C43.1
N$14
  Bottom 0.203: R47.1 C47.1 6.05,34.55 U8.3
N$15  (via drill 0.2 pad 0.33)
  Bottom 0.152: U3.J2 12.07,24.43 11.72,24.78 11.72,25.61 12.36,26.25 R40.1
  other vias: 12.12,24.43
N$16  (via drill 0.2 pad 0.33)
  Bottom 0.152: R41.1 13.42,26.25 12.24,25.07 U3.J1
  other vias: 12.12,25.07
N$17
  Bottom 0.152: U7.7 25.62,34.12 25.38,33.88 25.38,32.25 26.45,31.18 C38.1
N$18  (via drill 0.2 pad 0.33)
  Top 0.113: U3.K2 11.15,24.75 11.15,25.35 10.31,26.19 TP2.P$1
  Bottom 0.152: R42.1 11.36,26.02 11.36,24.54 U3.K2
  other vias: 11.47,24.43
N$19  (via drill 0.3 pad 0.55)
  Top 0.203: v0.88,34.75 0.88,33.1 U1.5
  Bottom 0.203: C2.1 R2.2 R1.1 v0.88,34.75
N$20  (via drill 0.3 pad 0.55)
  Top 0.203: U1.1 0.8,29.43 v0.75,29.38
  Bottom 0.203: R59.1 4,30 3.25,29.25 2.5,29.25 1.88,29.88 R3.2 1,30 0.75,29.75 v0.75,29.38 0.75,28.5 R4.1
N$21
  Bottom 0.152: C38.2 25.05,29.82 R38.2 25.23,29.61 25.25,29.5 R39.2
N$22  (via drill 0.2 pad 0.33)
  Bottom 0.152: U3.H7 12.22,21.73 12.22,22.52 11.78,22.98 10.97,22.98 10.57,23.38 R43.1
  other vias: 12.78,21.18
N$23
  pour Top (no thermals): 3.23,23.17 3.21,23.19 2.81,23.58 2.8,23.61 2.8,24.34 2.38,24.76 0.45,24.76 0.45,21.7 4.17,21.7 4.17,22.84 3.84,23.17
N$24
  Top 0.152: U3.B1 17.23,25.62 18.62,25.62 19,26 R11.2
N$25  (via drill 0.2 pad 0.33)
  Bottom 0.203: R34.2 14.12,19.25 13.5,19.88 U3.G9
  other vias: 13.43,19.88
N$26
  pour Bottom (no thermals): -0.32,38.43 2.83,38.43 3.18,38.45 3.53,38.53 3.87,38.65 4.18,38.82 4.46,39.04 4.71,39.29 4.93,39.57 5.1,39.88 5.22,40.22 5.3,40.57 5.32,40.92 5.32,44.73 5.23,44.82 -0.32,44.82
N$44
  Bottom 0.152: R21.1 R58.2 13.16,6.25 13.1,6.24 Q7.1
N$94  (via drill 0.2 pad 0.33)
  Bottom 0.152: R32.1 9.25,19.5 9.43,19.68 10.63,19.68 U3.K8
  other vias: 11.47,20.52
N$95  (via drill 0.2 pad 0.33)
  Bottom 0.152: U3.M8 8.03,20.52 6.75,19.25 R37.1
  other vias: 10.18,20.52
N$96  (via drill 0.2 pad 0.33)
  Bottom 0.152: U3.L8 10.32,20.02 8.52,20.02 8,19.5 R36.1
  other vias: 10.82,20.52
N$97  (via drill 0.2 pad 0.33)
  Bottom 0.113: 11.15,19.55 11.15,18.65
  Bottom 0.152: U3.K9 11.15,19.55 | 11.15,18.65 R33.1
  other vias: 11.47,19.88
N$99  (via drill 0.2 pad 0.33)
  Bottom 0.113: U3.J8 11.8,20.85 11.24,20.85 10.75,21.35 C51.1 R35.1
  other vias: 12.12,20.52
N$108
  Top 0.102: 12.47,24.08 12.47,25.5
  Top 0.113: U3.H3 12.47,24.08 | 12.47,25.5 11.88,26.09 TP3.P$1
N$110
  Top 0.102: 16.34,20.85 17.55,20.85
  Top 0.113: R12.2 19,21.5 18.2,21.5 17.55,20.85 | 16.34,20.85 16.34,20.86 U3.C7
N$120  (via drill 0.3 pad 0.55)
  Top 0.203: U2.5 5.55,26.32 v5.62,26.25
  Bottom 0.203: R8.1 5.75,26.38 v5.62,26.25 5.75,26.12 C10.1 R5.2
N$149
  pour Top (no thermals): 5.23,32.19 4.27,32.19 3.15,31.07 2.52,31.07 2.37,30.91 2.37,27.93 5.26,27.93 5.26,32.16
N$157  (via drill 0.3 pad 0.55)
  Top 0.203: v3.12,26.38 1.9,26.38 U2.1
  Bottom 0.203: v3.12,26.38 3.12,26.62 3,26.75 3,27.25 R9.1 R10.1
R_OUT  (via drill 0.3 pad 0.55)
  Top 0.152: v28.25,24.38 J3.1 22.88,24.38 22.75,24.5 22.75,26.62 25.25,29.12 25.25,30 26.88,31.62 26.88,33 26.5,33.38 J2.2 | J5.3 28.43,4.45 27.5,5.38 v27.5,5.5
  Bottom 0.152: v27.5,5.5 27.5,8.12 24,11.62 24,15.62 26,17.62 27.62,17.62 29.12,19.12 29.12,23.5 v28.25,24.38 28.18,24.45 D4.1 28.18,26.45 C40.1 R44.1
RK628_INTN_3V3  (via drill 0.25 pad 0.4, 0.3 pad 0.55)
  Top 0.1: 11.8,24.1 11.8,25.39
  Top 0.113: U3.J3 11.8,24.1 | 11.8,25.39 TP4.P$1
  Top 0.152: TP4.P$1 11,27.61 11.32,27.93 v11.31,27.95 | v20,29.25 20,30.12 18.88,31.25 v18.88,32
  Bottom 0.152: v11.31,27.95 12.36,29 19.75,29 v20,29.25 | v18.88,32 18.88,32.5 17.75,33.62 17.75,35.38 18.25,35.88 18.25,37.12 18.5,37.38 18.5,38.5 17.25,39.75 17.25,40.75 17.5,41 17.5,43.75 16.98,44.27 Q4.3 15.1,44.27 R55.2 14.88,45.38 R54.1
RK628_RSTN_3V3  (via drill 0.2 pad 0.33, 0.25 pad 0.4)
  Top 0.152: v11,30.75 11.06,30.69 11.06,29.06 v9.69,27.69
  Bottom 0.152: U3.H4 12.53,23.38 11.12,23.38 10,24.5 C5.2 9.12,25.62 9.12,27.12 v9.69,27.69 | R56.1 8.75,45.5 9,45.25 Q5.3 9,44.02 9.38,43.65 9.38,41.5 10.44,40.44 10.44,35.69 10,35.25 10,34.75 11,33.75 v11,30.75
  other vias: 12.78,23.12
RK628_XTALI
  Top 0.127: U3.M9 8.88,19.88 C13.2 8,20 7.75,19.75 6.75,19.75 6.1,20.4 Y5.1
RK628_XTALO
  Top 0.127: U3.L9 10.51,19.56 9.31,19.56 R6.1
SCL_CAM_1V8  (via drill 0.25 pad 0.4)
  Top 0.152: J1.2 21.75,42.38 20.89,43.23 v20.12,43.23 20.04,43.32 v19.16,43.32
  Bottom 0.152: Q2.2 18.38,42.4 R49.1 18.39,43.48 19,43.48 v19.16,43.32 | R7.1 20.12,45.12 v20.12,43.23
SDA_CAM_1V8  (via drill 0.25 pad 0.4)
  Top 0.152: J1.1 22.25,42.58 v22.72,43.05 22.72,44.47 23.75,45.5 v24.12,45.5
  Bottom 0.152: R52.1 21.88,42.4 Q3.2 22.05,42.48 22.33,42.76 22.48,42.76 22.72,43 v22.72,43.05 | v24.12,45.5 R50.1
SW1/MIPI_PWR0_CAM_OR_5V
  Top 0.152: J1.6 19.75,39.82 20.32,39.25 20.88,39.25 21,39.12 R60.1 21.35,38.15 21.48,38.15 21.63,38.01 21.86,38.01 22.57,37.3 22.57,36.8 22.8,36.57 22.8,33.93 22,33.13 19.25,33.13 18.62,33.75 18.62,34.12 19.36,34.86 19.36,35.73 U6.3
SW2
  Top 0.152: J1.9 18.25,39.49 19.12,38.62 R61.2 19.12,37.02 U6.1
VCC1V1_RK628  (via drill 0.2 pad 0.33, 0.3 pad 0.55, 0.35 pad 0.7)
  Top 0.203: L2.2 v3.5,19.25 | C14.2 v7.88,22
  Top 0.254: FB1.1 14.93,14.78 v15.04,14.66
  Bottom 0.203: C10.2 R5.1 6.75,23.12 v7.88,22
  other vias: 15.38,20.52 14.72,19.88 2.62,19.25 4.38,19.25 14.54,15.28
  pour Top (no thermals): 4.56,21.58 4.17,21.19 4.14,21.17 0.45,21.17 0.45,18.58 4.47,18.58 4.8,18.91 4.8,20.64 4.81,20.67 5.46,21.31 5.48,21.33 6.47,21.33 6.71,21.56 6.73,21.58 7.84,21.58 8.05,21.78 8.05,22.22 7.84,22.42 4.78,22.42 4.58,22.22 4.58,21.61
  pour Bottom (no thermals): 15.81,19.29 15.83,19.27 15.83,18.78 15.91,18.7 16.59,18.7 16.67,18.78 16.67,19.17 15.94,19.9 15.92,19.93 15.92,20.34 15.59,20.67 15.16,20.67 14.58,20.09 14.58,19.7 15.39,19.7 15.42,19.69
  pour Route15 (no thermals): 2.3,18.52 2.77,18.05 8.27,18.05 11.9,14.43 15.45,14.43 15.45,19.73 14.85,20.32 13.9,20.32 13.05,19.48 13.05,19.1 12.4,18.45 9.85,18.45 9.45,18.85 9.45,20.73 7.98,22.2 5.9,22.2 4.77,21.07 2.9,21.07 2.3,20.48
  pour Top (no thermals): 14.15,14.43 15.23,14.43 15.32,14.52 15.32,16.85 15.23,16.95 14.15,16.95 14.05,16.85 14.05,14.52
VCC5V0_SYS  (via drill 0.25 pad 0.4, 0.3 pad 0.55, 0.35 pad 0.7)
  Top 0.152: C35.1 v6.75,40 | C9.1 21.12,34.75 21.48,34.75 v21.87,35.13 22.19,35.46 22.19,36.31 22.12,36.38 U6.5 | v10.62,34.88 10.62,35.15 10.12,35.65 10.12,37.12 9.12,38.12 9.12,38.6 8.48,39.25 C52.1
  Top 0.203: U2.4 4.4,25.18 v4,25.58
  Top 0.254: C1.2 2.12,34.88 v2,34.75
  Route15 0.152: v21.87,35.13 20.13,35.13 19.5,34.5 17,34.5 16.75,34.25 13.38,34.25 12.75,33.62 11.88,33.62 v10.62,34.88
  Route15 0.203: v1.75,27.12 1.25,27.62 1.25,34 v2,34.75
  Bottom 0.152: D2.A 5.38,3.33 v5.38,2.75
  Bottom 0.203: v1.75,27.12 1.62,27.25 1,27.25 R4.2
  other vias: 2,35.75 6,40.88 6,40 6.75,40.88 4.38,2.75 5.38,1.88 4.38,1.88 5.03,25.57 4.53,25.17
  pour Top (no thermals): 1.84,32.49 3.04,32.49 3.19,32.65 3.19,35.6 2.66,36.13 1.84,36.13 1.62,35.91 1.62,32.71
  pour Top (rank 2, no thermals): 3.83,24.2 6.17,24.2 6.17,25.8 3.83,25.8
  pour Top (no thermals): 8.67,39.16 8.67,39.84 8.44,40.08 8.42,40.11 8.42,41.84 8.34,41.92 6.66,41.92 5.83,41.09 5.83,39.41 6.28,38.95 8.47,38.95
  pour Bottom (no thermals): 4.27,1.55 5.85,1.55 6.07,1.77 6.07,3.85 5.85,4.07 4.27,4.07 4.05,3.85 4.05,1.77
  pour Route15 (no thermals): 5.55,15.52 5.55,6.23 3.55,4.23 3.55,1.4 4.02,0.93 5.98,0.93 7.7,2.65 7.7,14.85 4.98,17.57 2.6,17.57 1.82,18.35 1.82,21.4 2.35,21.93 3.23,21.93 5.45,24.15 5.45,25.73 4.98,26.2 2.98,26.2 2.2,26.98 2.2,33.27 2.57,33.65 2.57,34.65 7.07,39.15 7.07,41.73 6.85,41.95 5.53,41.95 5.43,41.74 5.43,39.73 3.9,38.2 0.05,38.2 0.05,18.15 1.4,16.8 4.27,16.8
VCC5V_HDMI_RX  (via drill 0.3 pad 0.55)
  Bottom 0.152: 5.58,5.17 D2.C
  Bottom 0.203: v5.38,6.75 5.2,6.93 C22.2 | R21.2 10,4.88 9.12,4 7.88,4 | 7.88,4 6.75,4 5.58,5.17 | R27.1 8.25,8 8,7.75 8,6.88 7.88,6.75 7.88,4
  other vias: 5.75,6 5,6
  pour Top (no thermals): 5.56,11.44 5.56,7.35 4.68,6.48 4.68,5.9 4.9,5.68 5.85,5.68 5.94,5.77 5.94,10.02 6.69,10.77 6.69,11.44
  pour Bottom (no thermals): 5.68,8.1 5.68,7.98 5.52,7.82 4.27,7.82 4.06,7.6 4.06,5.02 4.27,4.81 5.94,4.81 5.94,7.27 7.44,8.77 7.44,9.73 7.23,9.94 6.56,9.94 6.56,8.98
VCC_1V8  (via drill 0.25 pad 0.4, 0.3 pad 0.4, 0.3 pad 0.55)
  Top 0.203: v24.5,38.62 23.88,38.62 R23.2
  Bottom 0.152: Q2.1 20.57,42.35 20.57,43.45 v20.75,43.62 | R7.2 20.82,45.42 v20.82,44.67 | Q3.1 23.95,41.3 v24,41.25 | v26.75,45.5 R50.2 | R53.2 13.29,45.2 v13.29,44.69
  Bottom 0.203: Q4.1 17,42.28 v17,43.5
  Bottom 0.305: v9.62,39.75 9.62,38.5 C50.1
  other vias: 9.62,39
  pour Bottom (no thermals): 7.9,37.93 9.95,37.93 9.95,39.85 9.85,39.95 7.9,39.95 7.43,39.48 7.43,38.4
  pour Route15 (no thermals): 23.68,42.52 23.68,39.15 24.18,38.65 24.18,38.27 24.27,38.18 24.85,38.18 24.95,38.27 24.95,38.73 24.45,39.23 24.45,42.9 25.98,44.43 26.35,44.43 26.95,45.02 26.95,45.7 26.02,45.7 25.4,45.07 20.4,45.07 19.65,44.32 16.98,44.32 16.35,44.95 13.02,44.95 9.3,41.23 9.3,38.77 9.4,38.68 9.85,38.68 10.07,38.9 10.07,40.15 13.23,43.3 22.9,43.3
VCC_3V3  (via drill 0.2 pad 0.33, 0.25 pad 0.4, 0.3 pad 0.55)
  Top 0.305: FB3.1 8.05,32.58 v7.82,32.82
  Route15 0.203: v14.62,11.25 13.75,12.12 13.22,12.12 11.59,13.75 9.38,13.75 9,14.12 9,15.38 7.38,17 5.75,17 4.62,18.12 2.62,18.12 2,18.75 2,20.88 2.75,21.62 3.88,21.62 4.89,22.64 7.76,22.64 8.25,23.12 11.62,23.12 11.75,23 12.25,23 U3.H5 | v1.88,28.12 2.25,28.5 6.75,28.5 6.88,28.62 v6.88,32.38
  Bottom 0.152: R48.2 17.38,44.83 v17.24,44.69 | v16.69,45.5 R54.2 | R54.2 | R51.2 v21.45,45.49 | v6.38,45.5 R56.2
  Bottom 0.203: R25.2 11.25,10.12 13.5,10.12 v14.62,11.25 | C2.2 R2.1 3.12,32.5 3.5,32.12 6.62,32.12 v6.88,32.38 7,32.5 R47.2 | R9.2 2.75,28.25 2,28.25 v1.88,28.12 | R57.2 v9.62,45.5
  Bottom 0.254: R46.2 v27,37.5
  other vias: 12.78,22.48 8.44,32.82
  pour Top (no thermals): 5.56,35.23 5.56,32.52 5.81,32.27 5.81,27.93 8.48,27.93 8.69,28.15 8.69,32.98 8.6,33.07 7.6,33.07 6.57,34.1 6.57,35.23 6.48,35.32 5.65,35.32
  pour Bottom (no thermals): 7.77,32.43 8.48,32.43 8.7,32.65 8.7,36.85 8.6,36.95 7.65,36.95 7.55,36.85 7.55,32.65
  pour Route15 (no thermals): 6.55,33.85 6.55,22.55 12.4,22.55 12.65,22.3 12.85,22.3 12.92,22.37 12.92,22.57 12.16,23.32 10.48,23.32 8.95,24.85 8.95,33.15 9.98,34.18 10.65,34.18 12.65,32.18 28.1,32.18 29.32,33.4 29.32,38.23 29.23,38.32 25.65,38.32 25.02,37.7 24.9,37.7 21.15,33.95 11.85,33.95 8.95,36.85 8.95,42.52 11.6,45.18 16.52,45.18 17.15,44.55 19.48,44.55 20.23,45.3 21.7,45.3 21.7,45.95 6.4,45.95 6.05,45.6 6.05,43.65 7.43,42.27 7.43,34.73
VCCA1V1_RK628  (via drill 0.2 pad 0.33, 0.35 pad 0.7)
  Top 0.254: FB1.2 16.57,16.5 v17.38,16.5
  Bottom 0.113: C27.2 13.25,18.88 13.25,19.4 U3.H9 U3.J9
  Bottom 0.254: C27.2 C28.2
  other vias: 12.78,19.88 12.12,19.88 12.12,21.18 16.02,22.48 15.38,23.12 14.72,23.77 14.07,23.77 18.12,15.88
  pour Top (no thermals): 15.91,14.45 18.47,14.45 18.55,14.53 18.55,16.84 18.47,16.92 15.91,16.92 15.83,16.84 15.83,14.53
  pour Bottom (no thermals): 16.43,21.65 16.43,19.77 16.93,19.27 16.93,15.65 17.15,15.43 18.35,15.43 18.57,15.65 18.57,18.23 17.45,19.35 17.45,23.95 16.77,23.95 16.22,23.4 15.53,23.4 14.85,24.07 14.02,24.07 13.8,23.85 13.8,23.52 13.9,23.43 14.65,23.43
  pour Bottom (no thermals): 13.05,19.15 13.05,18.9 13.68,18.27 13.68,15.9 15.15,14.43 17.73,14.43 18.57,15.27 18.57,16.23 17.98,16.82 16.77,16.82 16.15,16.2 14.73,16.2 14.57,16.35 14.57,18.23 14.35,18.45 13.98,18.45 13.7,18.73 13.7,19.98 12.35,21.32 11.93,21.32 11.93,19.77 12.02,19.68 12.52,19.68
VCCA3V3_RK628  (via drill 0.2 pad 0.33, 0.3 pad 0.55)
  Top 0.113: v10.38,32.12 10.12,31.88 FB3.2
  other vias: 10.18,19.23 12.12,19.23 15.38,22.48 14.72,23.12 16.02,23.77 10.38,32.88 10.38,33.62 10.38,31.38
  pour Route15 (no thermals): 13.15,22.21 13.02,22.07 12.48,22.07 12.23,22.32 10.9,22.32 9.68,21.1 9.68,19.02 10.02,18.68 12.1,18.68 12.45,19.02 12.45,19.9 14.73,22.18 15.35,22.18 15.57,22.4 15.57,22.73 14.96,23.35 13.85,23.35 13.71,23.5 13.71,23.9 13.98,24.18 15.52,24.18 15.8,23.9 15.8,23.65 15.9,23.55 16.23,23.55 16.32,23.65 16.32,24.35 16.1,24.57 13.35,24.57 10.82,27.1 10.82,33.6 10.6,33.82 10.02,33.82 9.3,33.1 9.3,25.02 10.77,23.55 12.27,23.55 12.9,22.93 13.02,22.93 13.15,22.79
  pour Bottom (no thermals): 11.8,16.55 12.45,16.55 12.45,19.35 12.35,19.45 11.9,19.45 11.8,19.35
  pour Top (no thermals): 9.02,31.18 10.7,31.18 10.7,34.6 9.98,35.32 8.93,35.32 8.93,31.27
  pour Bottom (no thermals): 15.15,24.18 15.52,24.18 15.68,24.02 15.68,23.77 15.79,23.65 16.11,23.65 16.63,24.18 18.1,24.18 18.32,24.4 18.32,25.1 18.23,25.2 14.93,25.2 14.93,24.4

## Text on the board
tPlace: R | L | R | L
bPlace: HDMI to MIPI Board / 07/16/2026